# Altium schematic sheet Main.SchDoc
size A4; SheetNumber: 1; SheetTotal: 3
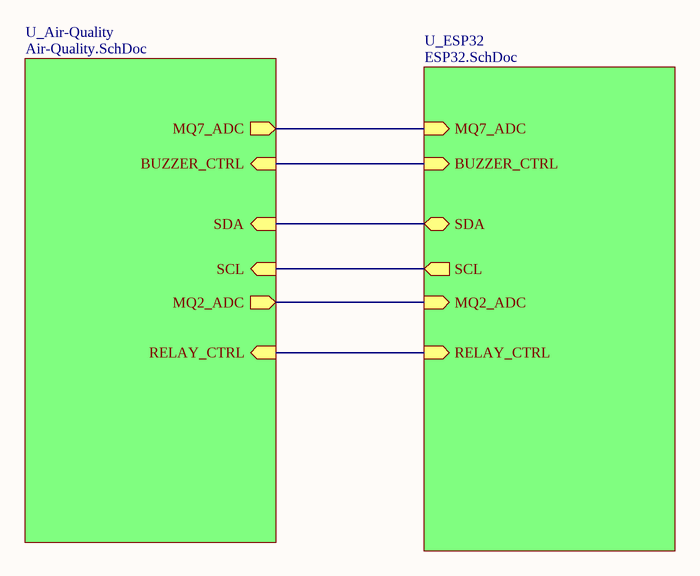
[diagram p0: Main.SchDoc]

## Sub-sheets
U_Air-Quality = Air-Quality.SchDoc: BUZZER_CTRL (in), RELAY_CTRL (in), MQ7_ADC (out), MQ2_ADC (out), SCL (in), SDA (in)
U_ESP32 = ESP32.SchDoc: SDA (bidir), MQ2_ADC (in), RELAY_CTRL (in), MQ7_ADC (in), BUZZER_CTRL (in), SCL (out)

## Nets
(unnamed): sheet U_ESP32/SDA, sheet U_Air-Quality/SDA
(unnamed): sheet U_ESP32/MQ2_ADC, sheet U_Air-Quality/MQ2_ADC
(unnamed): sheet U_ESP32/RELAY_CTRL, sheet U_Air-Quality/RELAY_CTRL
(unnamed): sheet U_ESP32/MQ7_ADC, sheet U_Air-Quality/MQ7_ADC
(unnamed): sheet U_ESP32/BUZZER_CTRL, sheet U_Air-Quality/BUZZER_CTRL
(unnamed): sheet U_ESP32/SCL, sheet U_Air-Quality/SCL